# Altium schematic sheet ads1299_Interface.SchDoc
size A4
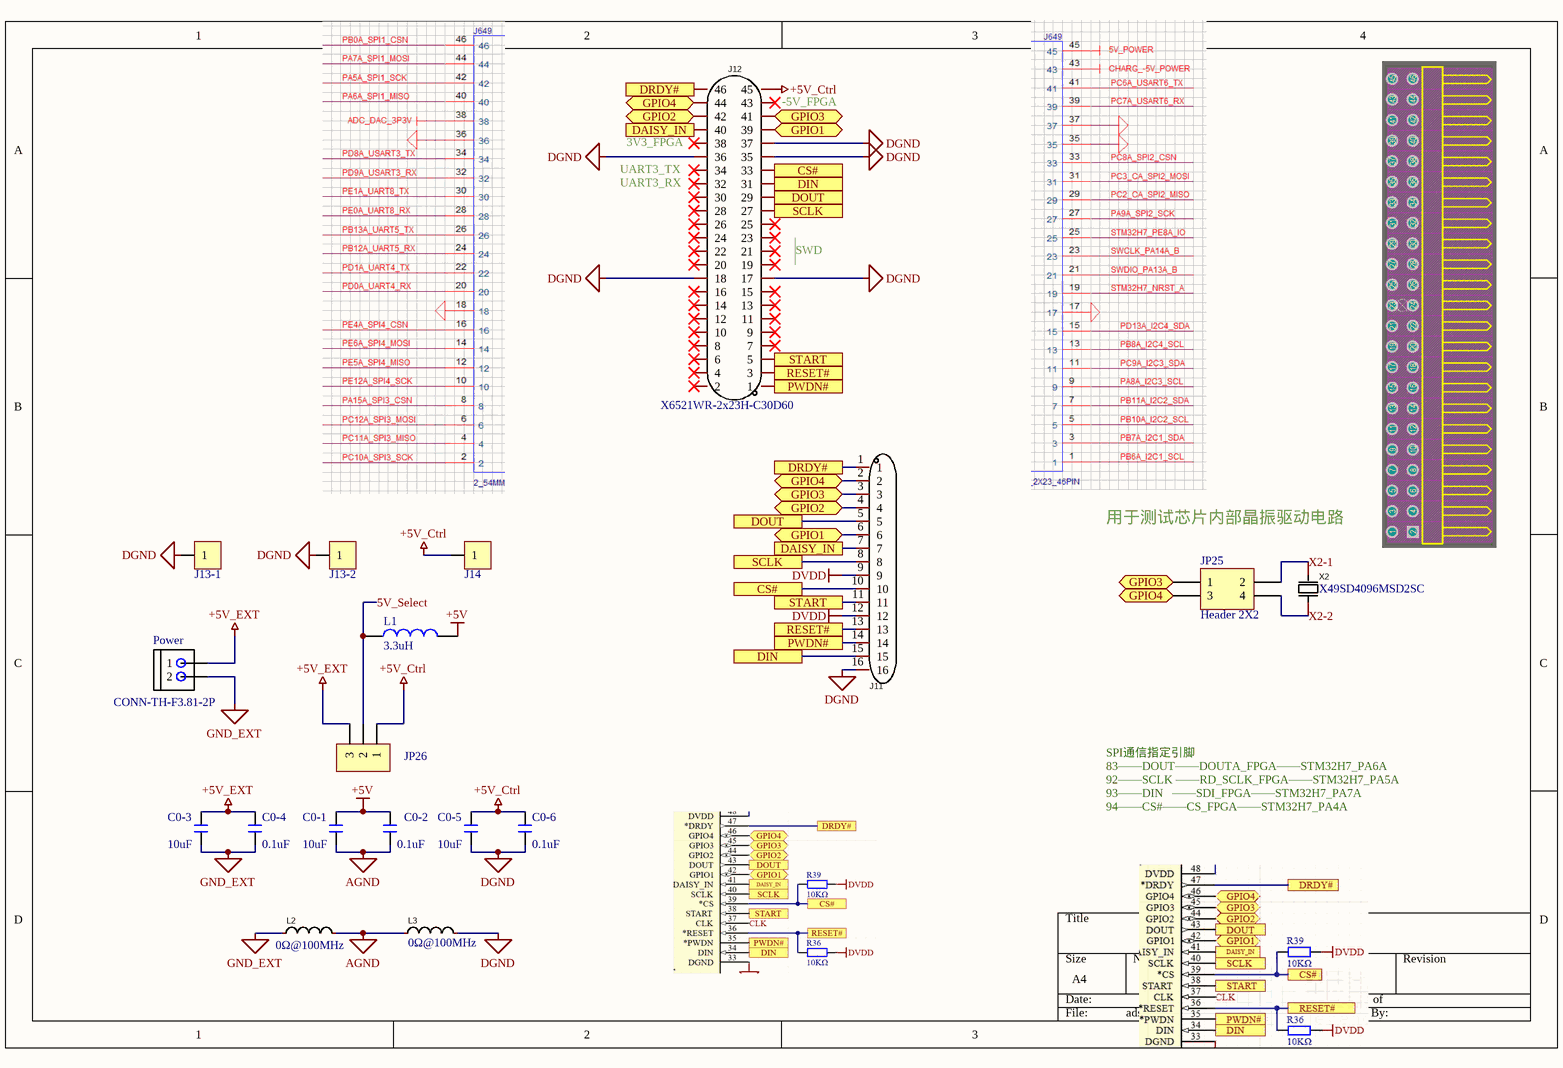
[diagram p0: ads1299_Interface.SchDoc]

## Parts
C0-1  10uF  [0603C]
C0-2  0.1uF  [0603C]
C0-3  10uF  [0603C]
C0-4  0.1uF  [0603C]
C0-5  10uF  [0603C]
C0-6  0.1uF  [0603C]
J11  KH-2.54PH180-1X16P-L11.5  [HDR-TH_16P-P2.54]  (value not drawn)
J12  X6521WR-2x23H-C30D60  [HDR-TH_2x23P-P2.54-Bent]
J13-1  Header_1P  [HDR-TH_1P]  (value not drawn)
J13-2  Header_1P  [HDR-TH_1P]  (value not drawn)
J14  Header_1P  [HDR-TH_1P]  (value not drawn)
JP25  Header 2X2  [HDR2.54-LI-2x2P]
JP26  HDR-1X3  [HDR2.54-LI-3P]  (value not drawn)
L1  3.3uH  [L 1206]
L2  0Ω@100MHz  [L 0603]
L3  0Ω@100MHz  [L 0603]
Power  CONN-TH-F3.81-2P  [CONN-TH_XY2500R-F-3.81-2P]
X2  X49SD4096MSD2SC  [HC-49US]

## Ports
CS#, DAISY_IN, DIN, DOUT, DRDY#, GPIO1 (bidir), GPIO2 (bidir), GPIO3 (bidir), GPIO4 (bidir), PWDN#, RESET#, SCLK, START

## Nets
+5V: C0-1.2 C0-2.2 L1.2
+5V_Ctrl: C0-5.2 C0-6.2 J12.45 J14.1 JP26.1
+5V_EXT: C0-3.2 C0-4.2 JP26.3 Power.1
AGND: C0-1.1 C0-2.1 L2.2 L3.1
DGND: C0-5.1 C0-6.1 J11.16 J12.17 J12.18 J12.35 J12.36 J12.37 J13-1.1 J13-2.1 L3.2
DVDD: J11.9 J11.12
GND_EXT: C0-3.1 C0-4.1 L2.1 Power.2
5V_Select: JP26.2 L1.1
CS#: J11.10 J12.33 ; port CS#
DAISY_IN: J11.7 J12.40 ; port DAISY_IN
DIN: J11.15 J12.31 ; port DIN
DOUT: J11.5 J12.29 ; port DOUT
DRDY#: J11.1 J12.46 ; port DRDY#
GPIO1: J11.6 J12.39 ; port GPIO1
GPIO2: J11.4 J12.42 ; port GPIO2
GPIO3: J11.3 J12.41 JP25.1 ; port GPIO3
GPIO4: J11.2 J12.44 JP25.3 ; port GPIO4
PWDN#: J11.14 J12.1 ; port PWDN#
RESET#: J11.13 J12.3 ; port RESET#
SCLK: J11.8 J12.27 ; port SCLK
START: J11.11 J12.5 ; port START
X2-1: JP25.2 X2.1(OSC1)
X2-2: JP25.4 X2.2(OSC2)

Not connected (* = marked no-connect by the designer): J12 2* 4* 6* 7* 8* 9* 10* 11* 12* 13* 14* 15* 16* 19* 20* 21* 22* 23* 24* 25* 26* 28* 30* 32* 34* 38* 43*

## Notes on the sheet
- (near J12) -5V_FPGA
- (near J12) UART3_RX
- (near J12) UART3_TX
- (near J12) 3V3_FPGA
- (near J12) SWD
- 用于测试芯片内部晶振驱动电路
- SPI通信指定引脚
  83——DOUT——DOUTA_FPGA——STM32H7_PA6A
  92——SCLK ——RD_SCLK_FPGA——STM32H7_PA5A
  93——DIN   ——SDI_FPGA——STM32H7_PA7A
  94——CS#——CS_FPGA——STM32H7_PA4A

## Library data of the parts
C0-1-C0-6 = C: Chip  Ceramic Capacitor; BOM名称: 无极性贴片电容; 版权归属: 源创客; 学习资源: www.ooocke.com
J11 = Header1x16: Manufacturer: kinghelm(金航标); Add into BOM: yes; Pitch: 2.54mm; Pin Structure: 1x16P; Circluar Pins/Square Pins: 方针; Current Rating (Max): 3A; Name: KH-2.54PH180-1X16P-L11.5; Symbol: KH-2.54PH180-1X16P-L11.5; Device: KH-2.54PH180-1X16P-L11.5; LCSC Part Name: 2.54mm 1x16P 直插 方针; Supplier Part: C2905491; Manufacturer Part: KH-2.54PH180-1X16P-L11.5; Supplier Footprint: 直插,P=2.54mm; JLCPCB Part Class: Extended Part; Datasheet: https://atta.szlcsc.com/upload/public/pdf/source/20211019/0B04AAAEA732E66331FBDF3E5963EEAF.pdf; Supplier: LCSC; Convert to PCB: yes; Number of Rows: 单排; Number of Pins: 16; Row Spacing: -; Mounting Type: 直插; Voltage Rating (Max): -; Length of Mating Pin: 6mm; Insulation Height: 2.5mm; Length of End Connection Pin: 3mm; Contact Material: -; Operating Temperature Range: -40℃~+105℃; Color: 黑色
J12 = Header_2.54mm_2x23P_Bent: Manufacturer: XKB Connectivity(中国星坤); Symbol: X6521WR-2×23H-C30D60; Add into BOM: yes; Pitch: 2.54mm; Pin Structure: 2x23P; Circluar Pins/Square Pins: 方针; Current Rating (Max): 3A; Voltage Rating (Max): 250V; Welding Temperature (Max): 260℃; Name: X6521WR-2x23H-C30D60; Device: X6521WR-2x23H-C30D60; LCSC Part Name: 2.54mm 2x23P 弯插 方针 高镀金 抗氧化; Supplier Part: C725935; Manufacturer Part: X6521WR-2x23H-C30D60; Supplier Footprint: 弯插,P=2.54mm; JLCPCB Part Class: Extended Part; Datasheet: https://atta.szlcsc.com/upload/public/pdf/source/20211009/B321D35F509179B46434BAB3052FF950.pdf; Supplier: LCSC; Convert to PCB: yes; Number of Rows: 双排; Number of Pins: 46; Row Spacing: 2.54mm; Mounting Type: 弯插; Length of Mating Pin: 6mm; Insulation Height: 2.5mm; Length of End Connection Pin: -; Contact Material: 黄铜; Contact Plating: 金; Operating Temperature Range: -40℃~+105℃; Color: 黑色
JP25 = Header 2X2: Header, 2-Pin, Dual row; LatestRevisionDate: 17-Jul-2002; LatestRevisionNote: Re-released for DXP Platform.; Publisher: Altium Limited
JP26 = Header 3_1: 3P接插件; 版权归属: 源创客; BOM名称: 3P接插件; 学习资源: www.ooocke.com
L1 = L 1206: 小功率贴片电感; 版权归属: 源创客; BOM名称: 小功率贴片电感; 学习资源: www.ooocke.com
L2 L3 = CBW160808U000T: 磁珠; Manufacturer: FH(风华); Add into BOM: yes; Tolerance: 0~15Ω; DC Resistance: 80mΩ; Current Rating: 1A; Circuits: 1; Name: CBW160808U000T; Symbol: CBW160808U000T; Device: CBW160808U000T; LCSC Part Name: 0Ω@100MHz 0~15Ω; Supplier Part: C139173; Manufacturer Part: CBW160808U000T; Supplier Footprint: 0603; JLCPCB Part Class: Extended Part; Datasheet: https://atta.szlcsc.com/upload/public/pdf/source/20171102/C139173_15096094127801078754.pdf; Supplier: LCSC; Convert to PCB: yes; Impedance @ Frequency: 0Ω@100MHz
X2 = Passive Oscillator: Manufacturer: YXC(扬兴晶振); Name: 4.096MHz; Symbol: X49SD4096MSD2SC-1; Add into BOM: yes; Crystal Type: 49S晶振; Value: 4.096MHz; Frequency Tolerance: ±20ppm; Frequency Stability: ±30ppm; Load Capacitance: 20pF; Device: X49SD4096MSD2SC-1; LCSC Part Name: HC-49US 4.096MHz ±20ppm 20pF; Supplier Part: C2226; Manufacturer Part: X49SD4096MSD2SC-1; Supplier Footprint: HC-49S; JLCPCB Part Class: Extended Part; Datasheet: https://atta.szlcsc.com/upload/public/pdf/source/20210903/A997D130AE99CBB55D9024F9BE6DA174.pdf; Supplier: LCSC; Convert to PCB: yes; Operating Temperature: -20℃~+70℃